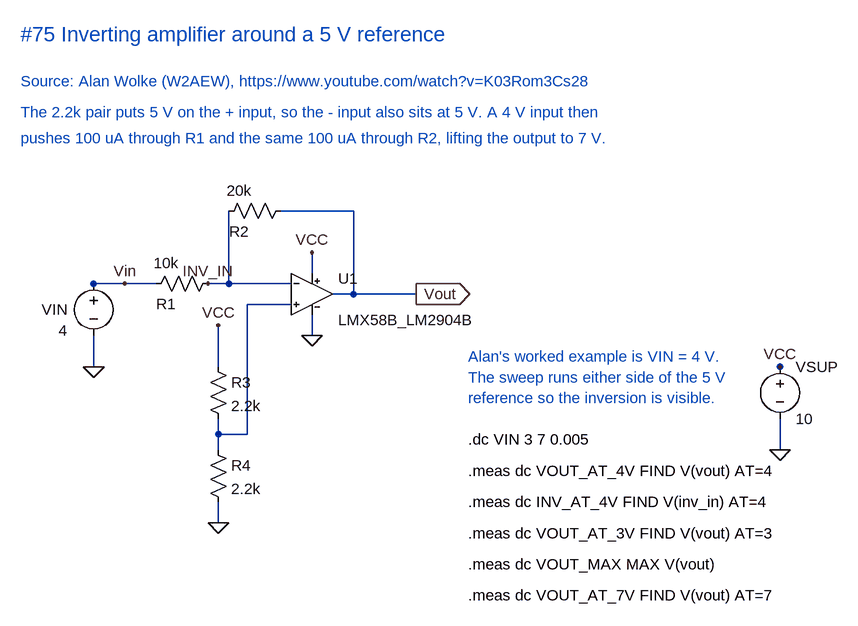
[diagram p0: schematic Inverting amplifier.asc]
Inverting amplifier.asc, the LTspice schematic file:
Version 4.1
SHEET 1 1200 900
WIRE 64 48 64 48
WIRE 160 48 64 48
WIRE 272 48 240 48
WIRE 368 48 272 48
WIRE 64 176 64 128
WIRE 272 -64 272 48
WIRE 464 -64 352 -64
WIRE 464 64 464 -64
WIRE 464 64 432 64
WIRE 560 64 464 64
WIRE 400 32 400 0
WIRE 400 128 400 96
WIRE 256 112 256 176
WIRE 256 304 256 256
WIRE 256 416 256 384
WIRE 300 280 256 280
WIRE 300 80 300 280
WIRE 368 80 300 80
WIRE 1120 256 1120 304
WIRE 1120 176 1120 176
FLAG 64 176 0
FLAG 400 128 0
FLAG 256 416 0
FLAG 1120 304 0
FLAG 400 0 VCC
FLAG 256 112 VCC
FLAG 1120 176 VCC
FLAG 560 64 Vout
IOPIN 560 64 Out
FLAG 112 48 Vin
FLAG 240 48 INV_IN
SYMBOL voltage 64 32 R0
WINDOW 123 0 0 Left 0
WINDOW 39 0 0 Left 0
WINDOW 0 -40 56 Right 2
WINDOW 3 -40 88 Right 2
SYMATTR InstName VIN
SYMATTR Value 4
SYMBOL res 144 64 R270
WINDOW 0 0 32 VBottom 2
WINDOW 3 32 32 VTop 2
SYMATTR InstName R1
SYMATTR Value 10k
SYMBOL res 256 -48 R270
WINDOW 0 0 32 VBottom 2
WINDOW 3 32 32 VTop 2
SYMATTR InstName R2
SYMATTR Value 20k
SYMBOL res 240 160 R0
SYMATTR InstName R3
SYMATTR Value 2.2k
SYMBOL res 240 288 R0
SYMATTR InstName R4
SYMATTR Value 2.2k
SYMBOL voltage 1120 160 R0
WINDOW 123 0 0 Left 0
WINDOW 39 0 0 Left 0
SYMATTR InstName VSUP
SYMATTR Value 10
SYMBOL ..\..\LTspice\Symbols\LMX58B_LM2904B 400 0 R0
WINDOW 0 40 40 Left 2
WINDOW 3 40 104 Left 2
SYMATTR InstName U1
SYMATTR Value LMX58B_LM2904B
TEXT -48 -336 Left 3 ;#75 Inverting amplifier around a 5 V reference
TEXT -48 -264 Left 2 ;Source: Alan Wolke (W2AEW), https://www.youtube.com/watch?v=K03Rom3Cs28
TEXT -48 -216 Left 2 ;The 2.2k pair puts 5 V on the + input, so the - input also sits at 5 V. A 4 V input then
TEXT -48 -176 Left 2 ;pushes 100 uA through R1 and the same 100 uA through R2, lifting the output to 7 V.
TEXT 640 160 Left 2 ;Alan's worked example is VIN = 4 V.
TEXT 640 192 Left 2 ;The sweep runs either side of the 5 V
TEXT 640 224 Left 2 ;reference so the inversion is visible.
TEXT 640 288 Left 2 !.dc VIN 3 7 0.005
TEXT 640 336 Left 2 !.meas dc VOUT_AT_4V FIND V(vout) AT=4
TEXT 640 384 Left 2 !.meas dc INV_AT_4V FIND V(inv_in) AT=4
TEXT 640 432 Left 2 !.meas dc VOUT_AT_3V FIND V(vout) AT=3
TEXT 640 480 Left 2 !.meas dc VOUT_MAX MAX V(vout)
TEXT 640 528 Left 2 !.meas dc VOUT_AT_7V FIND V(vout) AT=7

The netlist it stands for:
* Inverting amplifier.asc
VIN Vin 0 4
R1 Vin INV_IN 10k
R2 INV_IN Vout 20k
R3 VCC N001 2.2k
R4 N001 0 2.2k
VSUP VCC 0 10
X§U1 N001 INV_IN VCC 0 Vout LMX58B_LM2904B  ; pins In+ In- V+ V- OUT
* #75 Inverting amplifier around a 5 V reference
* Source: Alan Wolke (W2AEW), https://www.youtube.com/watch?v=K03Rom3Cs28
* The 2.2k pair puts 5 V on the + input, so the - input also sits at 5 V. A 4 V input then
* pushes 100 uA through R1 and the same 100 uA through R2, lifting the output to 7 V.
* Alan's worked example is VIN = 4 V.
* The sweep runs either side of the 5 V
* reference so the inversion is visible.
.dc VIN 3 7 0.005
.meas dc VOUT_AT_4V FIND V(vout) AT=4
.meas dc INV_AT_4V FIND V(inv_in) AT=4
.meas dc VOUT_AT_3V FIND V(vout) AT=3
.meas dc VOUT_MAX MAX V(vout)
.meas dc VOUT_AT_7V FIND V(vout) AT=7
.lib ..\..\LTspice\Models\Texas-Instruments\lmx58b_lm2904b.lib
.backanno
.end